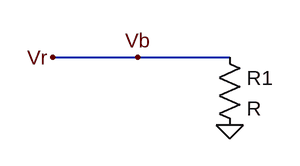
[diagram p0: schematic etiquetas-varias-mayor-x.asc]
etiquetas-varias-mayor-x.asc, the LTspice schematic file:
Version 4
SHEET 1 880 680
WIRE 0 0 208 0
FLAG 0 0 Vr
FLAG 100 0 Vb
FLAG 208 80 0
SYMBOL res 192 -16 R0
SYMATTR InstName R1

The netlist it stands for:
* etiquetas-varias-mayor-x.asc
R1 Vb 0 R
.backanno
.end